# Altium schematic sheet BMI270.SchDoc
size A; SheetNumber: 2; SheetTotal: 6
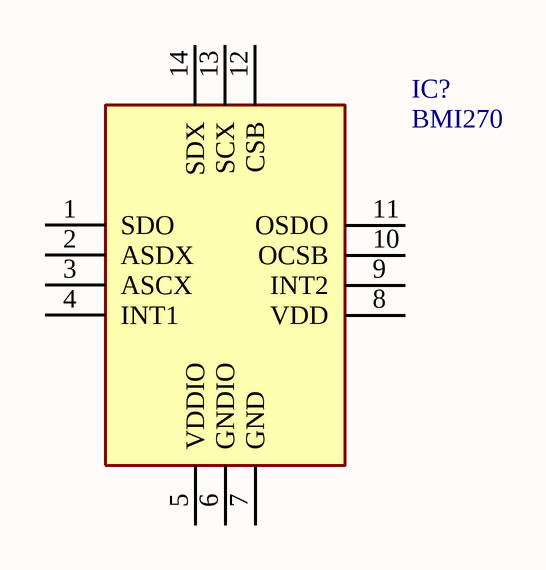
[diagram p0: BMI270.SchDoc]

## Parts
IC?  BMI270  [BMI270]

## Nets

Not connected (* = marked no-connect by the designer): IC? 1(SDO) 2(ASDX) 3(ASCX) 4(INT1) 5(VDDIO) 6(GNDIO) 7(GND) 8(VDD) 9(INT2) 10(OCSB) 11(OSDO) 12(CSB) 13(SCX) 14(SDX)

## Library data of the parts
IC? = BMI270: Integrated Circuit; Manufacturer_Name: BOSCH; Datasheet Link: https://www.bosch-sensortec.com/media/boschsensortec/downloads/datasheets/bst-bmi270-ds000.pdf; Height: 0.87mm; Manufacturer_Part_Number: BMI270; Mouser Part Number: 262-BMI270; Mouser Price/Stock: https://www.mouser.co.uk/ProductDetail/Bosch-Sensortec/BMI270?qs=u16ybLDytRYIj%252BjQEee88A%3D%3D; Arrow Part Number: BMI270; Arrow Price/Stock: https://www.arrow.com/en/products/bmi270/bosch-sensortec?utm_currency=USD&region=europe